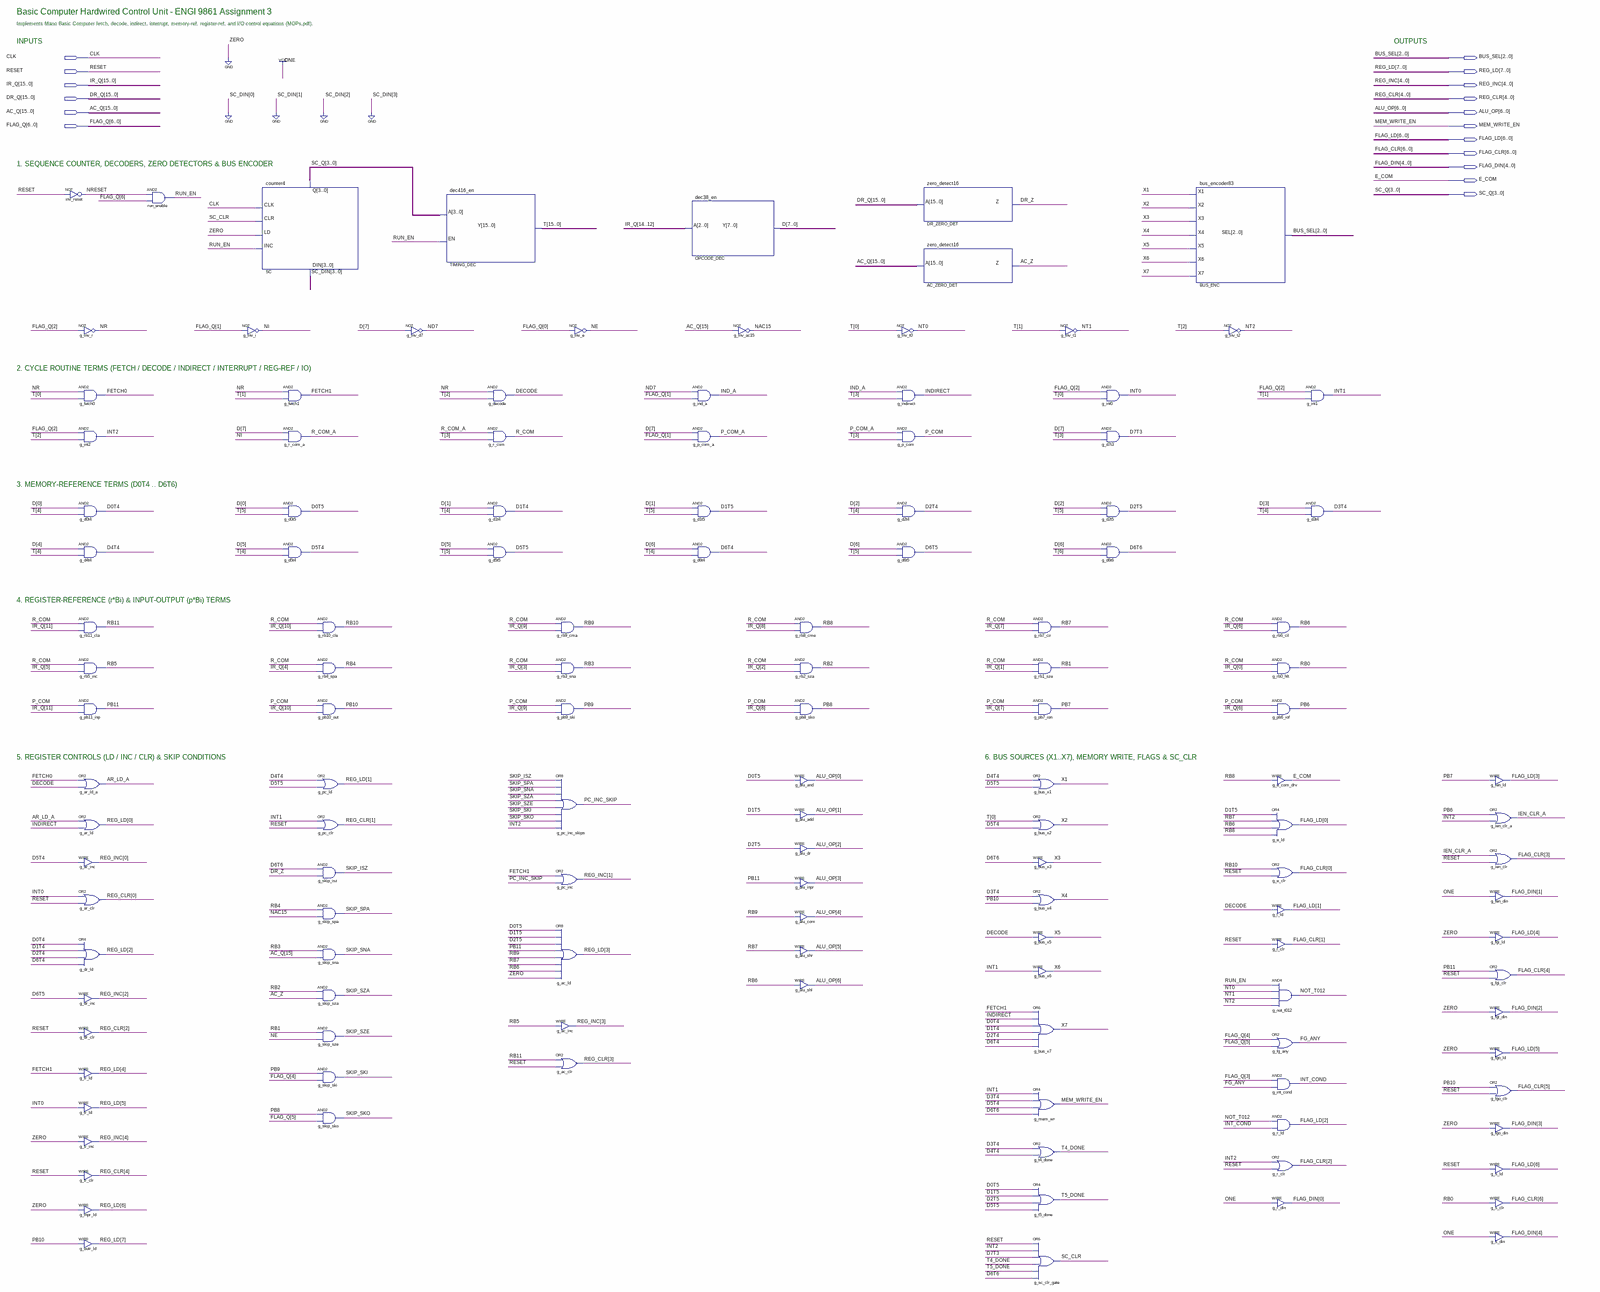
[diagram p0: schematic sheet, whole]
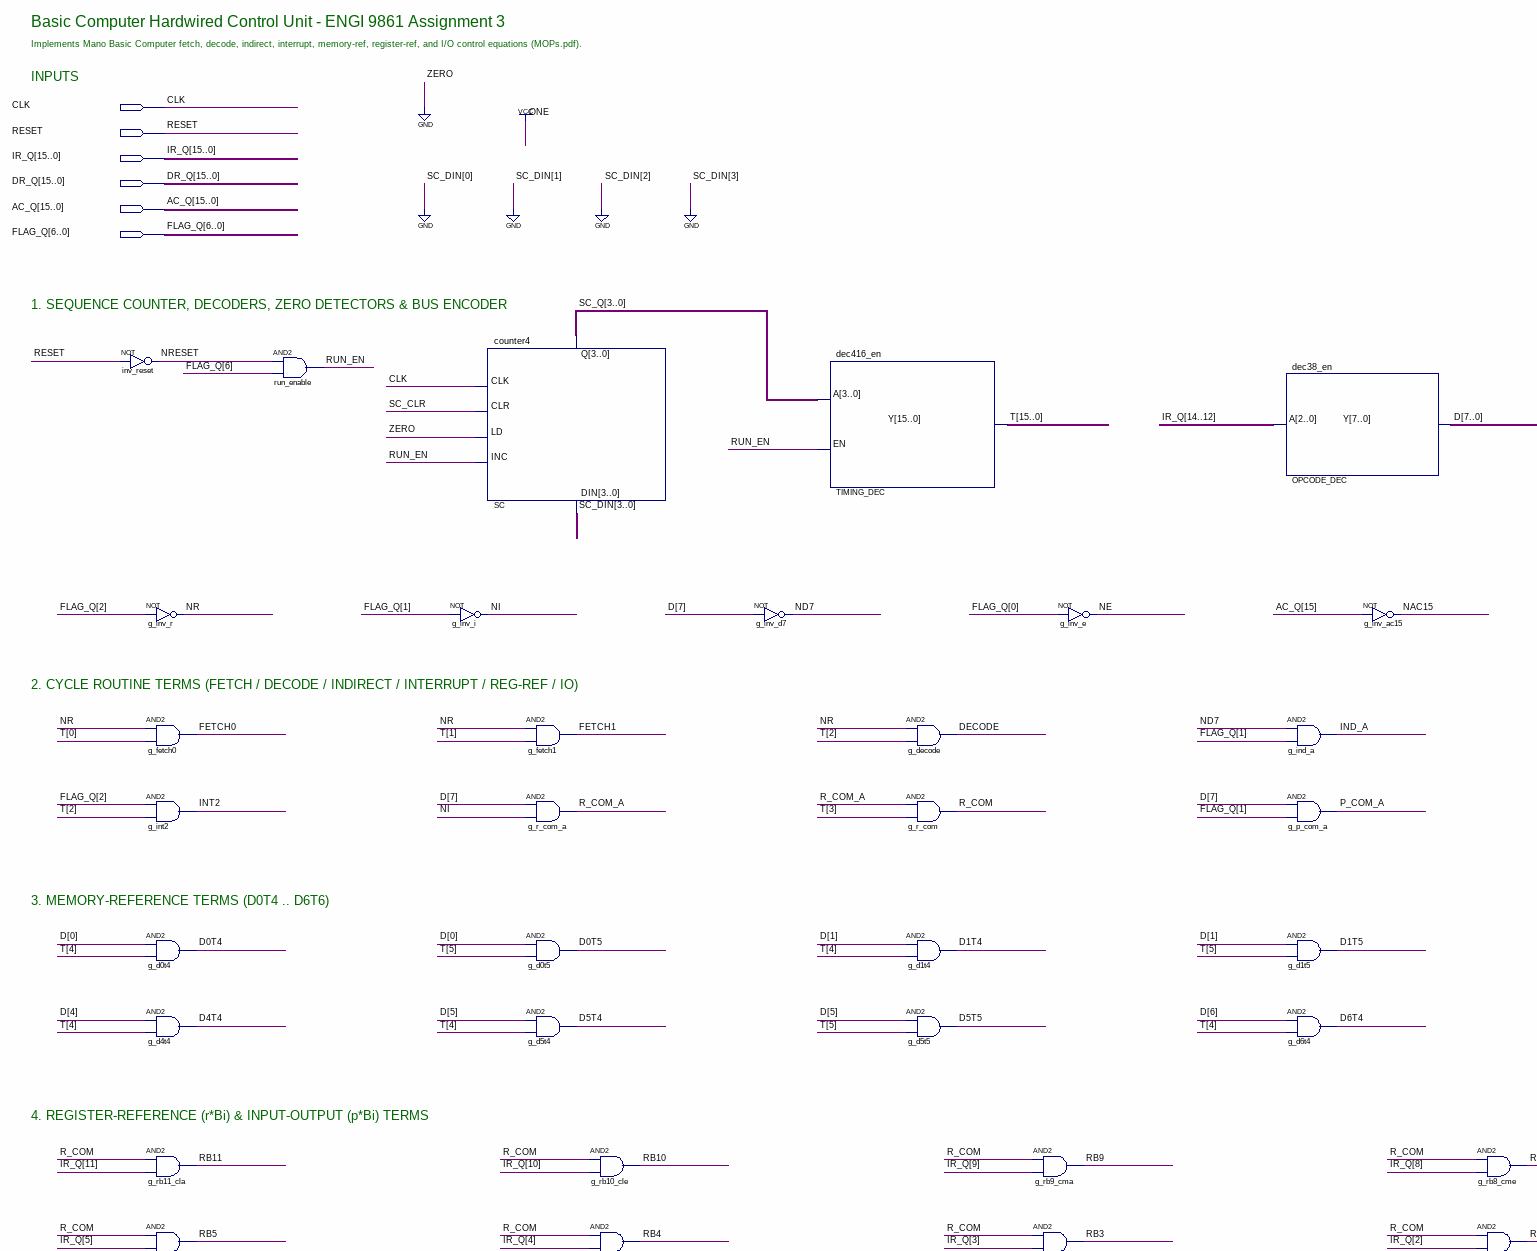
[diagram p1: schematic sheet, upper left part]
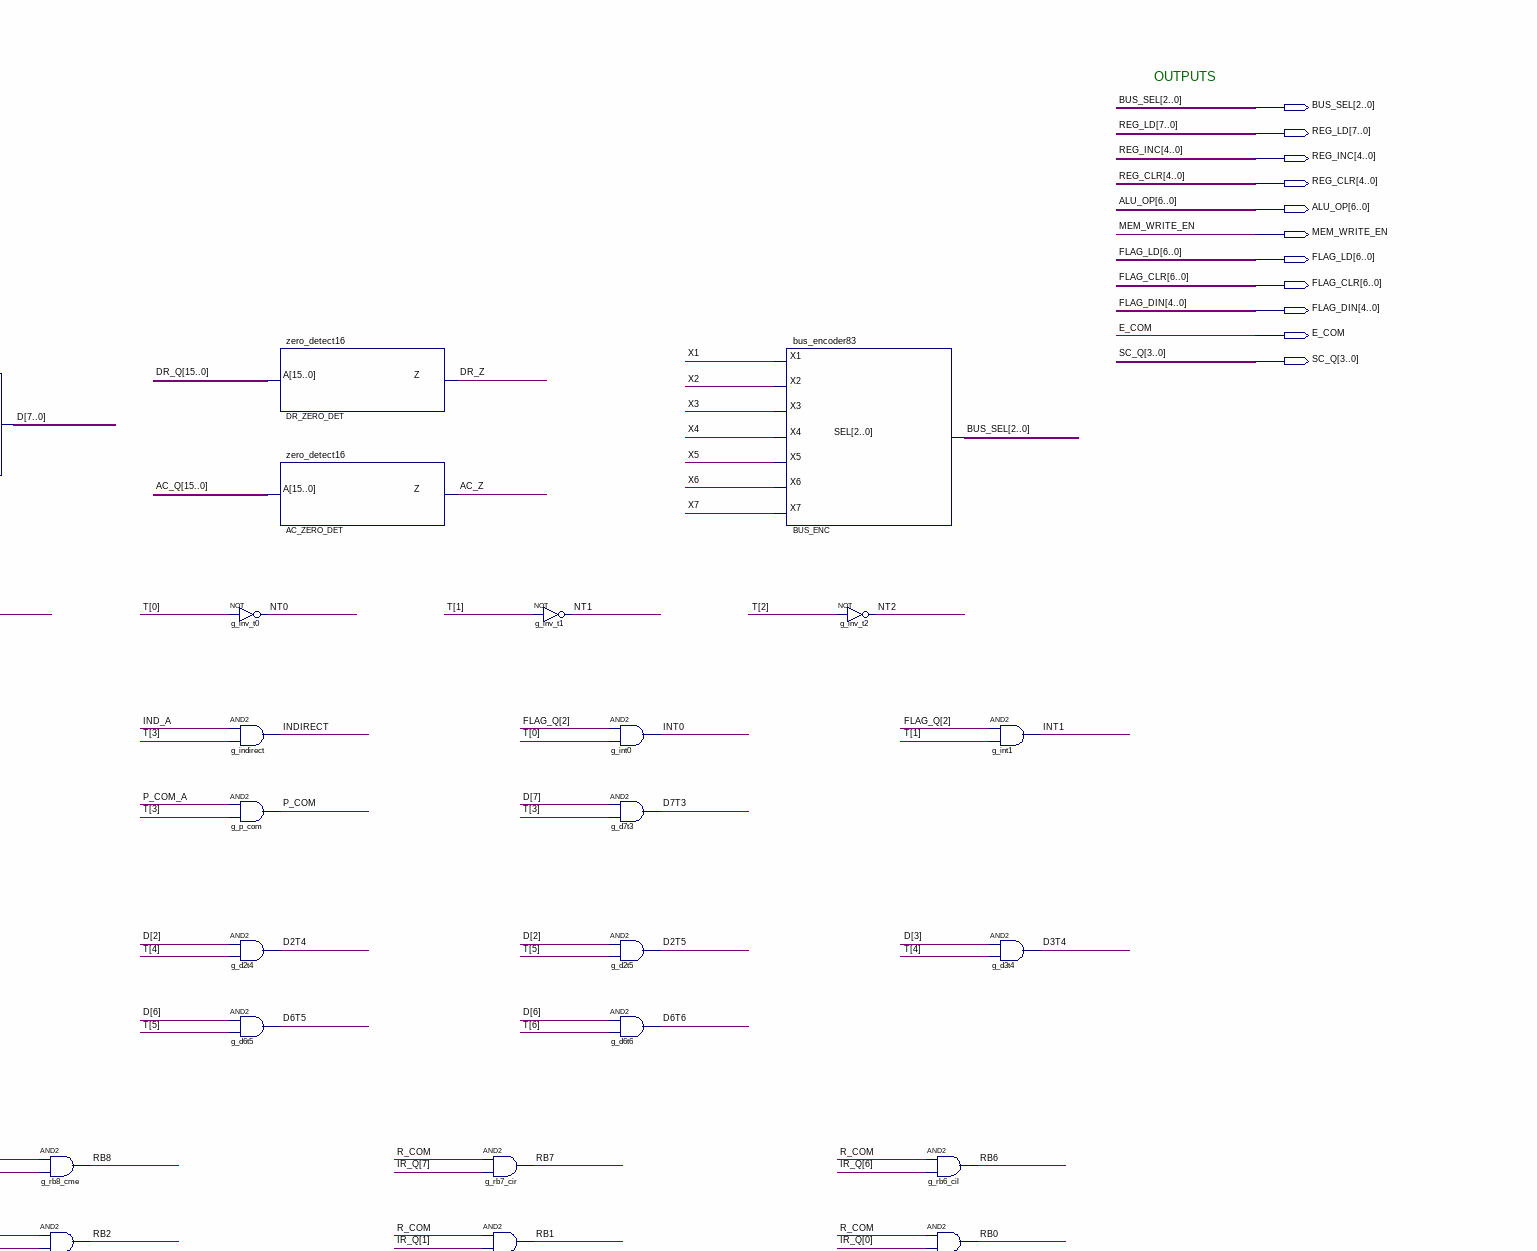
[diagram p2: schematic sheet, upper right part]
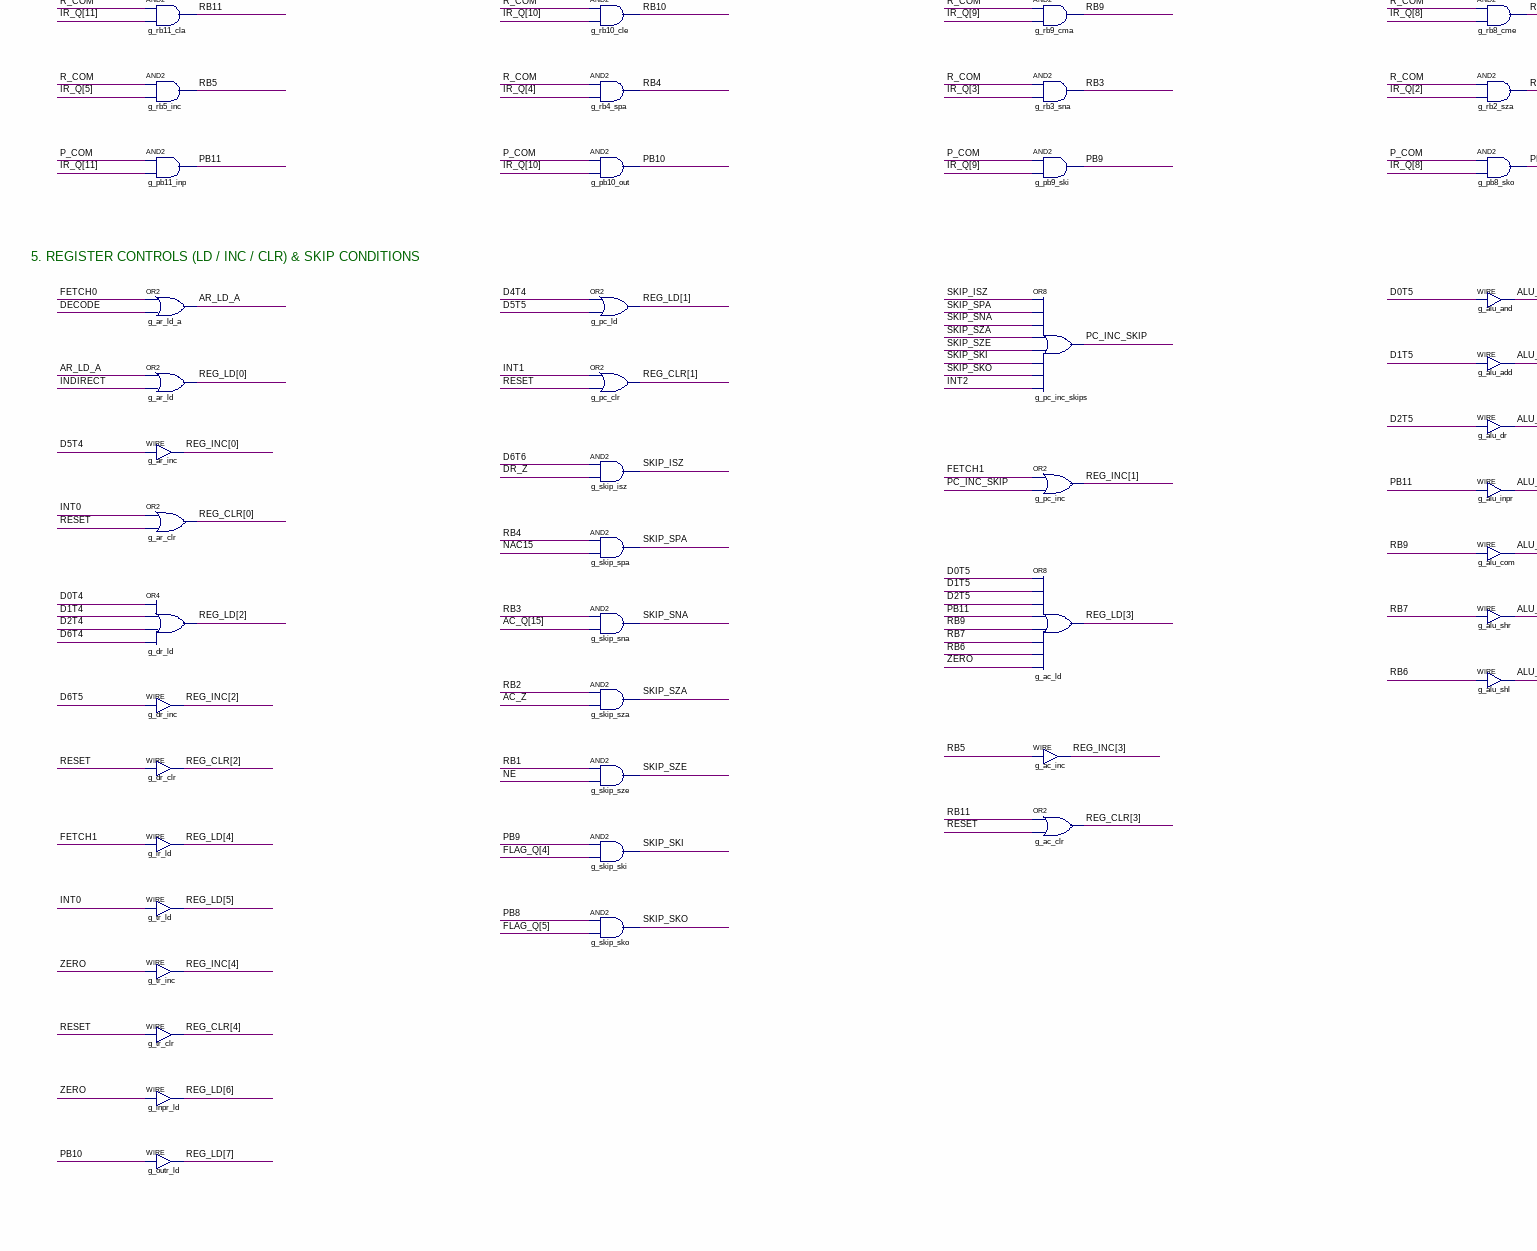
[diagram p3: schematic sheet, lower left part]
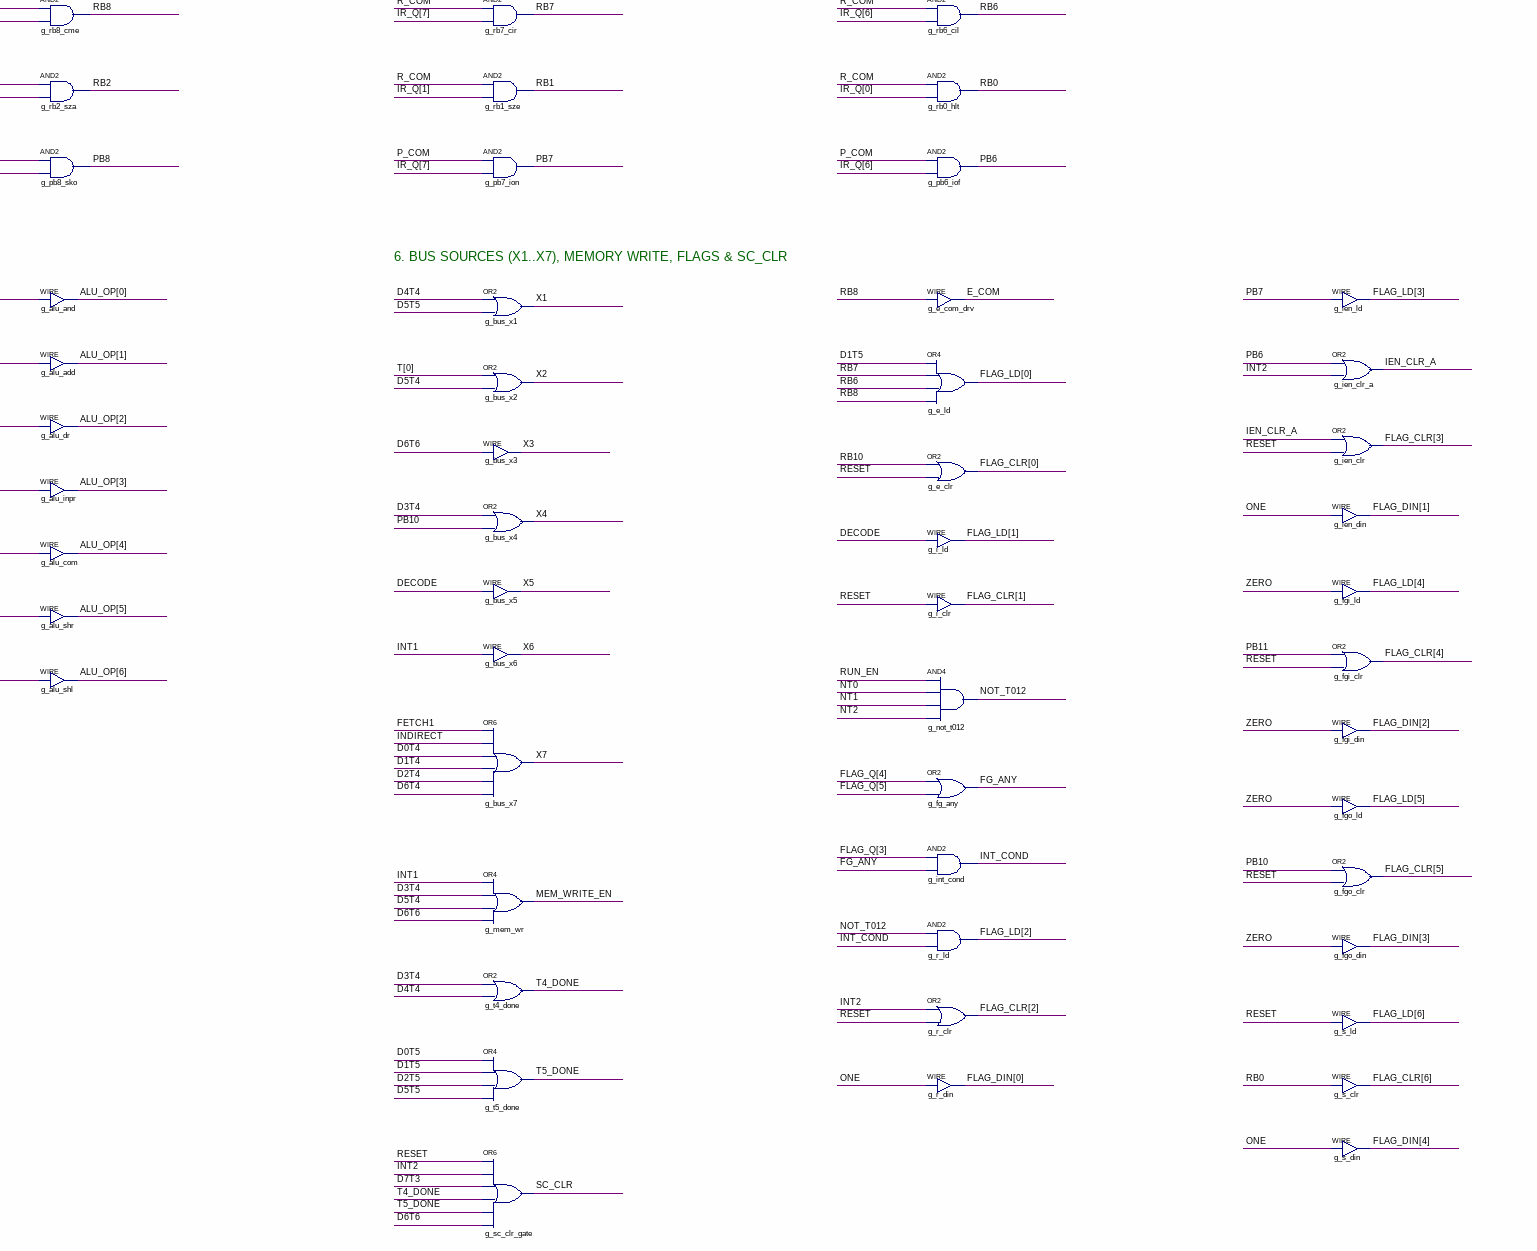
[diagram p4: schematic sheet, lower right part]
// Quartus schematic control_unit.bdf as structural Verilog: 129 symbols, 17 pins
module control_unit (
  input  CLK,
  input  RESET,
  input  [15:0] IR_Q,
  input  [15:0] DR_Q,
  input  [15:0] AC_Q,
  input  [6:0] FLAG_Q,
  output [2:0] BUS_SEL,
  output [7:0] REG_LD,
  output [4:0] REG_INC,
  output [4:0] REG_CLR,
  output [6:0] ALU_OP,
  output MEM_WRITE_EN,
  output [6:0] FLAG_LD,
  output [6:0] FLAG_CLR,
  output [4:0] FLAG_DIN,
  output E_COM,
  output [3:0] SC_Q
);

  wire AC_Z, AR_LD_A, D0T4, D0T5, D1T4, D1T5, D2T4, D2T5, D3T4, D4T4, D5T4, D5T5, D6T4, D6T5, D6T6, D7T3,
       DECODE, DR_Z, FETCH0, FETCH1, FG_ANY, IEN_CLR_A, IND_A, INDIRECT, INT0, INT1, INT2, INT_COND, NAC15,
       ND7, NE, NI, NOT_T012, NR, NRESET, NT0, NT1, NT2, P_COM, P_COM_A, PB6, PB7, PB8, PB9, PB10, PB11,
       PC_INC_SKIP, R_COM, R_COM_A, RB0, RB1, RB2, RB3, RB4, RB5, RB6, RB7, RB8, RB9, RB10, RB11, RUN_EN,
       SC_CLR, SKIP_ISZ, SKIP_SKI, SKIP_SKO, SKIP_SNA, SKIP_SPA, SKIP_SZA, SKIP_SZE, T4_DONE, T5_DONE, X1,
       X2, X3, X4, X5, X6, X7;
  wire [7:0] D;
  wire [15:0] T;

  not inv_reset (NRESET, RESET);
  not g_inv_r (NR, FLAG_Q[2]);
  and g_fetch0 (FETCH0, NR, T[0]);
  and g_int2 (INT2, FLAG_Q[2], T[2]);
  and g_d0t4 (D0T4, D[0], T[4]);
  and g_d4t4 (D4T4, D[4], T[4]);
  and g_rb11_cla (RB11, R_COM, IR_Q[11]);
  and g_rb5_inc (RB5, R_COM, IR_Q[5]);
  and g_pb11_inp (PB11, P_COM, IR_Q[11]);
  or g_ar_ld_a (AR_LD_A, FETCH0, DECODE);
  or g_ar_ld (REG_LD[0], AR_LD_A, INDIRECT);
  assign REG_INC[0] = D5T4;  // WIRE g_ar_inc
  or g_ar_clr (REG_CLR[0], INT0, RESET);
  or g_dr_ld (REG_LD[2], D0T4, D1T4, D2T4, D6T4);
  assign REG_INC[2] = D6T5;  // WIRE g_dr_inc
  assign REG_CLR[2] = RESET;  // WIRE g_dr_clr
  assign REG_LD[4] = FETCH1;  // WIRE g_ir_ld
  assign REG_LD[5] = INT0;  // WIRE g_tr_ld
  assign REG_INC[4] = 1'b0;  // WIRE g_tr_inc
  assign REG_CLR[4] = RESET;  // WIRE g_tr_clr
  assign REG_LD[6] = 1'b0;  // WIRE g_inpr_ld
  assign REG_LD[7] = PB10;  // WIRE g_outr_ld
  and run_enable (RUN_EN, NRESET, FLAG_Q[6]);
  not g_inv_i (NI, FLAG_Q[1]);
  counter4 SC (.CLK(CLK), .CLR(SC_CLR), .LD(1'b0), .INC(RUN_EN), .DIN(4'b0000), .Q(SC_Q));
  and g_fetch1 (FETCH1, NR, T[1]);
  and g_r_com_a (R_COM_A, D[7], NI);
  and g_d0t5 (D0T5, D[0], T[5]);
  and g_d5t4 (D5T4, D[5], T[4]);
  and g_rb10_cle (RB10, R_COM, IR_Q[10]);
  and g_rb4_spa (RB4, R_COM, IR_Q[4]);
  and g_pb10_out (PB10, P_COM, IR_Q[10]);
  or g_pc_ld (REG_LD[1], D4T4, D5T5);
  or g_pc_clr (REG_CLR[1], INT1, RESET);
  and g_skip_isz (SKIP_ISZ, D6T6, DR_Z);
  and g_skip_spa (SKIP_SPA, RB4, NAC15);
  and g_skip_sna (SKIP_SNA, RB3, AC_Q[15]);
  and g_skip_sza (SKIP_SZA, RB2, AC_Z);
  and g_skip_sze (SKIP_SZE, RB1, NE);
  and g_skip_ski (SKIP_SKI, PB9, FLAG_Q[4]);
  and g_skip_sko (SKIP_SKO, PB8, FLAG_Q[5]);
  not g_inv_d7 (ND7, D[7]);
  dec416_en TIMING_DEC (.A(SC_Q), .EN(RUN_EN), .Y(T));
  and g_decode (DECODE, NR, T[2]);
  and g_r_com (R_COM, R_COM_A, T[3]);
  and g_d1t4 (D1T4, D[1], T[4]);
  and g_d5t5 (D5T5, D[5], T[5]);
  not g_inv_e (NE, FLAG_Q[0]);
  and g_rb9_cma (RB9, R_COM, IR_Q[9]);
  and g_rb3_sna (RB3, R_COM, IR_Q[3]);
  and g_pb9_ski (PB9, P_COM, IR_Q[9]);
  or g_pc_inc_skips (PC_INC_SKIP, SKIP_ISZ, SKIP_SPA, SKIP_SNA, SKIP_SZA, SKIP_SZE, SKIP_SKI, SKIP_SKO, INT2);
  or g_pc_inc (REG_INC[1], FETCH1, PC_INC_SKIP);
  or g_ac_ld (REG_LD[3], D0T5, D1T5, D2T5, PB11, RB9, RB7, RB6, 1'b0);
  assign REG_INC[3] = RB5;  // WIRE g_ac_inc
  or g_ac_clr (REG_CLR[3], RB11, RESET);
  dec38_en OPCODE_DEC (.A(IR_Q[14:12]), .Y(D));
  and g_ind_a (IND_A, ND7, FLAG_Q[1]);
  and g_p_com_a (P_COM_A, D[7], FLAG_Q[1]);
  and g_d1t5 (D1T5, D[1], T[5]);
  and g_d6t4 (D6T4, D[6], T[4]);
  not g_inv_ac15 (NAC15, AC_Q[15]);
  and g_rb8_cme (RB8, R_COM, IR_Q[8]);
  and g_rb2_sza (RB2, R_COM, IR_Q[2]);
  and g_pb8_sko (PB8, P_COM, IR_Q[8]);
  assign ALU_OP[0] = D0T5;  // WIRE g_alu_and
  assign ALU_OP[1] = D1T5;  // WIRE g_alu_add
  assign ALU_OP[2] = D2T5;  // WIRE g_alu_dr
  assign ALU_OP[3] = PB11;  // WIRE g_alu_inpr
  assign ALU_OP[4] = RB9;  // WIRE g_alu_com
  assign ALU_OP[5] = RB7;  // WIRE g_alu_shr
  assign ALU_OP[6] = RB6;  // WIRE g_alu_shl
  not g_inv_t0 (NT0, T[0]);
  and g_indirect (INDIRECT, IND_A, T[3]);
  and g_p_com (P_COM, P_COM_A, T[3]);
  and g_d2t4 (D2T4, D[2], T[4]);
  and g_d6t5 (D6T5, D[6], T[5]);
  zero_detect16 DR_ZERO_DET (.A(DR_Q), .Z(DR_Z));
  zero_detect16 AC_ZERO_DET (.A(AC_Q), .Z(AC_Z));
  and g_rb7_cir (RB7, R_COM, IR_Q[7]);
  and g_rb1_sze (RB1, R_COM, IR_Q[1]);
  and g_pb7_ion (PB7, P_COM, IR_Q[7]);
  or g_bus_x1 (X1, D4T4, D5T5);
  or g_bus_x2 (X2, T[0], D5T4);
  assign X3 = D6T6;  // WIRE g_bus_x3
  or g_bus_x4 (X4, D3T4, PB10);
  assign X5 = DECODE;  // WIRE g_bus_x5
  assign X6 = INT1;  // WIRE g_bus_x6
  or g_bus_x7 (X7, FETCH1, INDIRECT, D0T4, D1T4, D2T4, D6T4);
  or g_mem_wr (MEM_WRITE_EN, INT1, D3T4, D5T4, D6T6);
  or g_t4_done (T4_DONE, D3T4, D4T4);
  or g_t5_done (T5_DONE, D0T5, D1T5, D2T5, D5T5);
  or g_sc_clr_gate (SC_CLR, RESET, INT2, D7T3, T4_DONE, T5_DONE, D6T6);
  not g_inv_t1 (NT1, T[1]);
  and g_int0 (INT0, FLAG_Q[2], T[0]);
  and g_d7t3 (D7T3, D[7], T[3]);
  and g_d2t5 (D2T5, D[2], T[5]);
  and g_d6t6 (D6T6, D[6], T[6]);
  bus_encoder83 BUS_ENC (.X1(X1), .X2(X2), .X3(X3), .X4(X4), .X5(X5), .X6(X6), .X7(X7), .SEL(BUS_SEL));
  not g_inv_t2 (NT2, T[2]);
  and g_rb6_cil (RB6, R_COM, IR_Q[6]);
  and g_rb0_hlt (RB0, R_COM, IR_Q[0]);
  and g_pb6_iof (PB6, P_COM, IR_Q[6]);
  assign E_COM = RB8;  // WIRE g_e_com_drv
  or g_e_ld (FLAG_LD[0], D1T5, RB7, RB6, RB8);
  or g_e_clr (FLAG_CLR[0], RB10, RESET);
  assign FLAG_LD[1] = DECODE;  // WIRE g_i_ld
  assign FLAG_CLR[1] = RESET;  // WIRE g_i_clr
  and g_not_t012 (NOT_T012, RUN_EN, NT0, NT1, NT2);
  or g_fg_any (FG_ANY, FLAG_Q[4], FLAG_Q[5]);
  and g_int_cond (INT_COND, FLAG_Q[3], FG_ANY);
  and g_r_ld (FLAG_LD[2], NOT_T012, INT_COND);
  or g_r_clr (FLAG_CLR[2], INT2, RESET);
  assign FLAG_DIN[0] = 1'b1;  // WIRE g_r_din
  and g_int1 (INT1, FLAG_Q[2], T[1]);
  and g_d3t4 (D3T4, D[3], T[4]);
  assign FLAG_LD[3] = PB7;  // WIRE g_ien_ld
  or g_ien_clr_a (IEN_CLR_A, PB6, INT2);
  or g_ien_clr (FLAG_CLR[3], IEN_CLR_A, RESET);
  assign FLAG_DIN[1] = 1'b1;  // WIRE g_ien_din
  assign FLAG_LD[4] = 1'b0;  // WIRE g_fgi_ld
  or g_fgi_clr (FLAG_CLR[4], PB11, RESET);
  assign FLAG_DIN[2] = 1'b0;  // WIRE g_fgi_din
  assign FLAG_LD[5] = 1'b0;  // WIRE g_fgo_ld
  or g_fgo_clr (FLAG_CLR[5], PB10, RESET);
  assign FLAG_DIN[3] = 1'b0;  // WIRE g_fgo_din
  assign FLAG_LD[6] = RESET;  // WIRE g_s_ld
  assign FLAG_CLR[6] = RB0;  // WIRE g_s_clr
  assign FLAG_DIN[4] = 1'b1;  // WIRE g_s_din

  // Notes on the sheet:
  //   Basic Computer Hardwired Control Unit - ENGI 9861 Assignment 3
  //   Implements Mano Basic Computer fetch, decode, indirect, interrupt, memory-ref, register-ref, and I/O control equations (MOPs.pdf).
  //   INPUTS
  //   OUTPUTS
  //   1. SEQUENCE COUNTER, DECODERS, ZERO DETECTORS & BUS ENCODER
  //   2. CYCLE ROUTINE TERMS (FETCH / DECODE / INDIRECT / INTERRUPT / REG-REF / IO)
  //   3. MEMORY-REFERENCE TERMS (D0T4 .. D6T6)
  //   4. REGISTER-REFERENCE (r*Bi) & INPUT-OUTPUT (p*Bi) TERMS
  //   5. REGISTER CONTROLS (LD / INC / CLR) & SKIP CONDITIONS
  //   6. BUS SOURCES (X1..X7), MEMORY WRITE, FLAGS & SC_CLR
endmodule
